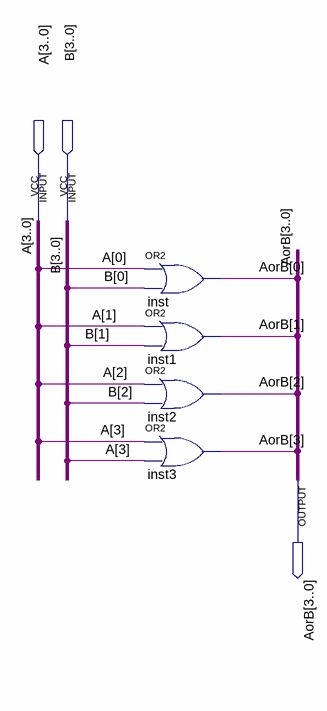
[diagram p0: schematic sheet]
// Quartus schematic AorB.bdf as structural Verilog: 4 symbols, 3 pins
module AorB (
  input  [3:0] A,
  input  [3:0] B,
  output [3:0] AorB
);

  or inst (AorB[0], A[0], B[0]);
  or inst1 (AorB[1], A[1], B[1]);
  or inst2 (AorB[2], A[2], B[2]);
  or inst3 (AorB[3], A[3], A[3]);
endmodule
